# Altium schematic sheet Power.SchDoc: Power: AC input, 5 V, and 3V3
size A3; SheetNumber: Sheet 1 of 3
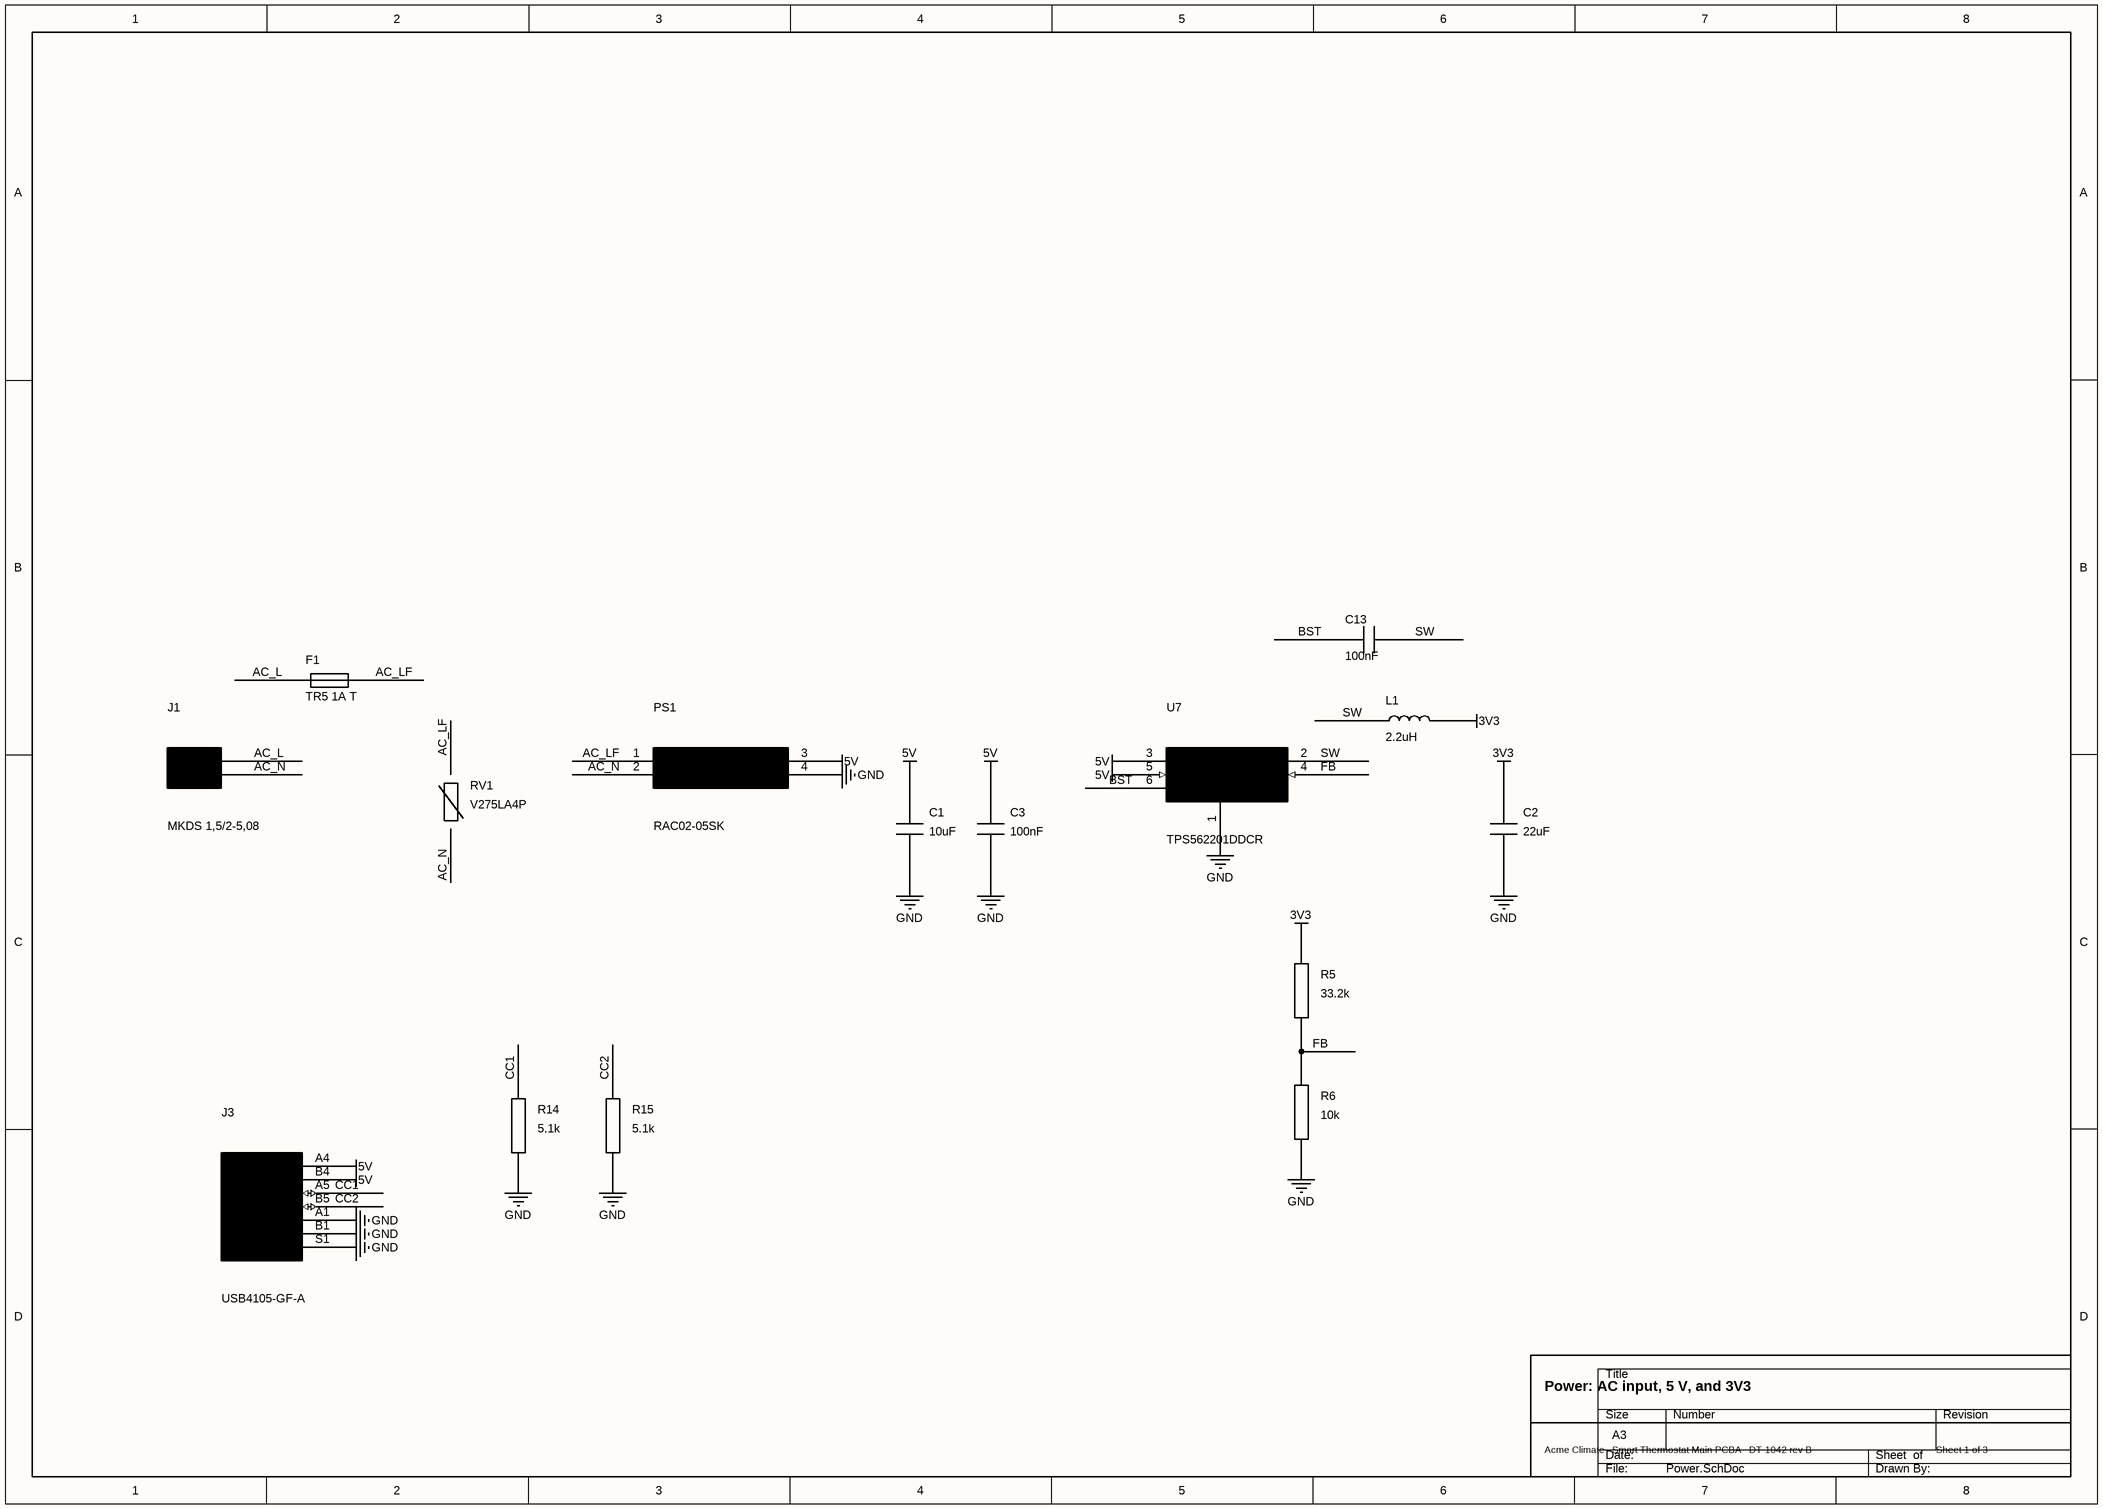
[diagram p0: Power.SchDoc]

## Parts
C1  10uF
C2  22uF
C3  100nF
C13  100nF
F1  TR5 1A T
J1  MKDS 1,5/2-5,08
J3  USB4105-GF-A
L1  2.2uH
PS1  RAC02-05SK
R5  33.2k
R6  10k
R14  5.1k
R15  5.1k
RV1  V275LA4P
U7  TPS562201DDCR

## Nets
3V3: C2.1 L1.2 R5.1
5V: C1.1 C3.1 J3.A4(VBUS) J3.B4(VBUS) PS1.3(+VOUT) U7.3(VIN) U7.5(EN)
GND: C1.2 C2.2 C3.2 J3.A1(GND) J3.B1(GND) J3.S1(SHIELD) PS1.4(-VOUT) R6.2 R14.2 R15.2 U7.1(GND)
AC_L: F1.1 J1.1
AC_LF: F1.2 PS1.1(AC/L) RV1.1
AC_N: J1.2 PS1.2(AC/N) RV1.2
BST: C13.1 U7.6(VBST)
CC1: J3.A5(CC1) R14.1
CC2: J3.B5(CC2) R15.1
FB: R5.2 R6.1 U7.4(VFB)
SW: C13.2 L1.1 U7.2(SW)

## Notes on the sheet
- Acme Climate · Smart Thermostat Main PCBA · DT-1042 rev B

## Library data of the parts
C1 = C: CAP CER 10UF 25V X5R 0805; Manufacturer Part Number: CL21A106KAYNNNE; Manufacturer: Samsung
C2 = C: CAP CER 22UF 25V X5R 0805; Manufacturer Part Number: CL21A226MAQNNNE; Manufacturer: Samsung
C3 C13 = C: CAP CER 0.1UF 16V X7R 0402; Manufacturer Part Number: GRM155R71C104KA88D; Manufacturer: Murata
F1 = Fuse: FUSE BRD MNT 1A 250VAC RADIAL TR5; Manufacturer Part Number: 37211000411; Manufacturer: Littelfuse
J1 = TerminalBlock_2: TERM BLK 2POS SIDE ENTRY 5.08MM PCB; Manufacturer Part Number: 1729128; Manufacturer: Phoenix Contact
J3 = USB_C_Receptacle_PowerOnly: CONN RCPT USB2.0 TYPE-C 16POS SMD; Manufacturer: GCT; Manufacturer Part Number: USB4105-GF-A
L1 = L: FIXED IND 2.2UH 5.5A 35 MOHM SMD; Manufacturer Part Number: XAL4020-222MEB; Manufacturer: Coilcraft
PS1 = RAC02-05SK: AC/DC CONVERTER 5V 2W SIP-4; Manufacturer: RECOM Power; Manufacturer Part Number: RAC02-05SK
R5 = R: RES SMD 33.2k 1% 1/16W 0402; Manufacturer Part Number: RC0402FR-0733K2L; Manufacturer: Yageo
R6 = R: RES SMD 10k 1% 1/16W 0402; Manufacturer Part Number: RC0402FR-0710KL; Manufacturer: Yageo
R14 R15 = R: RES SMD 5.1k 1% 1/16W 0402; Manufacturer Part Number: RC0402FR-075K1L; Manufacturer: Yageo
RV1 = Varistor: VARISTOR 430V 1.2KA DISC 7MM; Manufacturer: Littelfuse; Manufacturer Part Number: V275LA4P
U7 = TPS562201: IC REG BUCK ADJ 2A SOT23-6; Manufacturer: Texas Instruments; Manufacturer Part Number: TPS562201DDCR